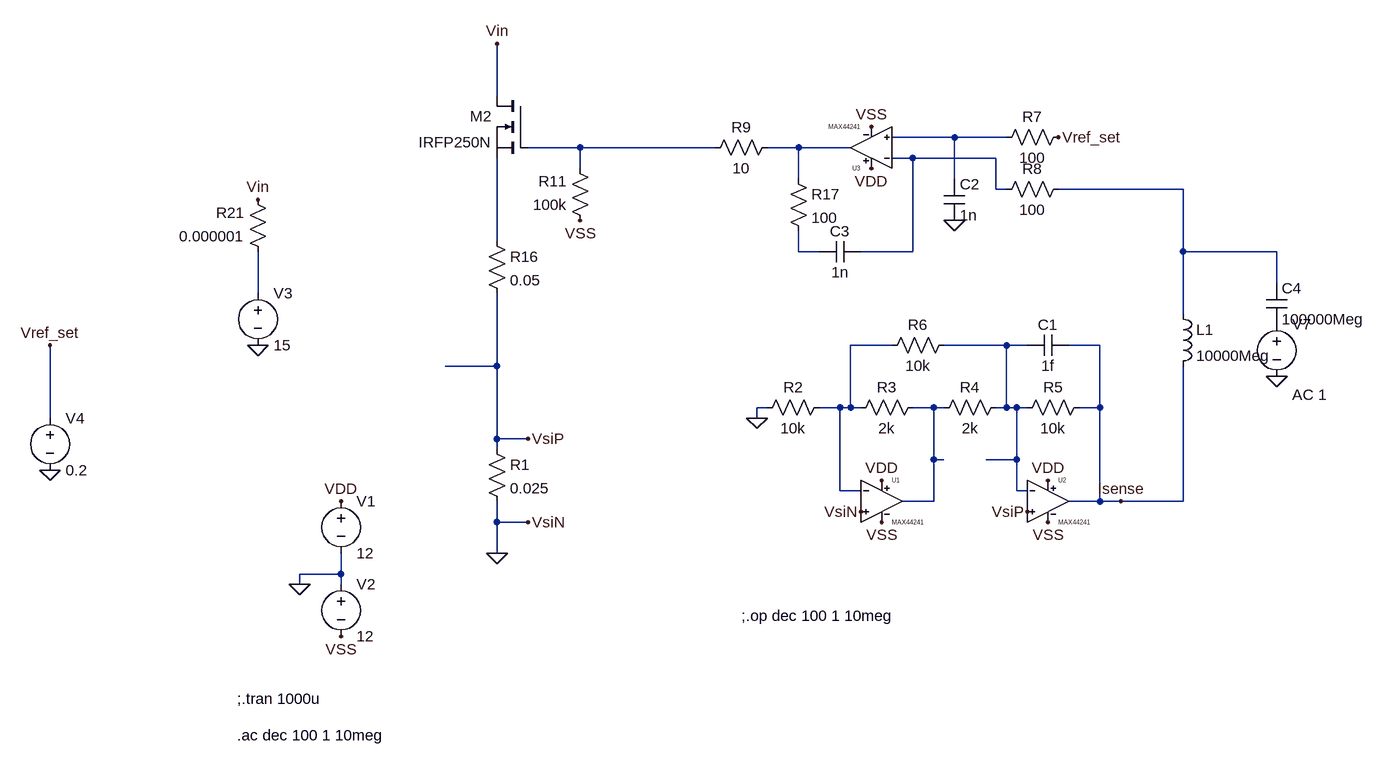
[diagram p0: schematic dc_load_transients_ac_analysis.asc]
dc_load_transients_ac_analysis.asc, the LTspice schematic file:
Version 4
SHEET 1 1884 680
WIRE -352 -336 -352 -416
WIRE 352 -272 256 -272
WIRE 432 -272 352 -272
WIRE -224 -256 -304 -256
WIRE -16 -256 -224 -256
WIRE 112 -256 64 -256
WIRE 192 -256 112 -256
WIRE 288 -240 256 -240
WIRE 416 -240 288 -240
WIRE -224 -224 -224 -256
WIRE 112 -208 112 -256
WIRE 352 -208 352 -272
WIRE 416 -192 416 -240
WIRE 432 -192 416 -192
WIRE 704 -192 512 -192
WIRE -352 -112 -352 -240
WIRE 112 -96 112 -128
WIRE 144 -96 112 -96
WIRE 288 -96 288 -240
WIRE 288 -96 208 -96
WIRE 704 -96 704 -192
WIRE 848 -96 704 -96
WIRE 848 -48 848 -96
WIRE -720 -32 -720 -96
WIRE 704 0 704 -96
WIRE 256 48 192 48
WIRE 432 48 336 48
WIRE 464 48 432 48
WIRE 576 48 528 48
WIRE -352 80 -352 -32
WIRE -352 80 -432 80
WIRE 64 144 48 144
WIRE 176 144 144 144
WIRE 192 144 192 48
WIRE 192 144 176 144
WIRE 208 144 192 144
WIRE 320 144 288 144
WIRE 336 144 320 144
WIRE 432 144 432 48
WIRE 432 144 416 144
WIRE 448 144 432 144
WIRE 464 144 448 144
WIRE 576 144 576 48
WIRE 576 144 544 144
WIRE -1040 160 -1040 48
WIRE 48 160 48 144
WIRE -352 192 -352 80
WIRE -304 192 -352 192
WIRE -352 208 -352 192
WIRE 320 224 320 144
WIRE 336 224 320 224
WIRE 448 224 448 144
WIRE 448 224 400 224
WIRE 176 272 176 144
WIRE 208 272 176 272
WIRE 448 272 448 224
WIRE 464 272 448 272
WIRE 320 288 320 224
WIRE 320 288 272 288
WIRE 576 288 576 144
WIRE 576 288 528 288
WIRE 608 288 576 288
WIRE 704 288 704 80
WIRE 704 288 608 288
WIRE -352 320 -352 288
WIRE -304 320 -352 320
WIRE -352 368 -352 320
WIRE -592 400 -592 368
WIRE -592 400 -656 400
WIRE -656 416 -656 400
WIRE -592 416 -592 400
FLAG -352 368 0
FLAG -592 288 VDD
FLAG -592 496 VSS
FLAG -656 416 0
FLAG 240 256 VDD
FLAG 496 256 VDD
FLAG 240 320 VSS
FLAG 496 320 VSS
FLAG 48 160 0
FLAG -304 192 VsiP
FLAG 464 304 VsiP
FLAG -304 320 VsiN
FLAG 208 304 VsiN
FLAG 608 288 Isense
FLAG -720 48 0
FLAG -720 -176 Vin
FLAG -1040 48 Vref_set
FLAG -1040 240 0
FLAG 352 -144 0
FLAG 512 -272 Vref_set
FLAG -224 -144 VSS
FLAG -352 -416 Vin
FLAG 224 -224 VDD
FLAG 224 -288 VSS
FLAG 848 96 0
DATAFLAG 704 288 ""
DATAFLAG -352 80 ""
DATAFLAG -352 -192 ""
DATAFLAG -1040 80 ""
DATAFLAG 368 -272 ""
DATAFLAG 288 -240 ""
DATAFLAG 704 -96 ""
DATAFLAG -352 -400 ""
DATAFLAG -208 -256 ""
DATAFLAG 176 272 ""
DATAFLAG -352 320 ""
DATAFLAG -352 192 ""
DATAFLAG 464 304 ""
DATAFLAG 176 256 ""
SYMBOL my\\MAX44241 240 224 R0
SYMATTR InstName U1
SYMBOL my\\MAX44241 496 224 R0
SYMATTR InstName U2
SYMBOL res -368 192 R0
SYMATTR InstName R1
SYMATTR Value 0.025
SYMBOL res 160 128 R90
WINDOW 0 0 56 VBottom 2
WINDOW 3 32 56 VTop 2
SYMATTR InstName R2
SYMATTR Value 10k
SYMBOL res 304 128 R90
WINDOW 0 0 56 VBottom 2
WINDOW 3 32 56 VTop 2
SYMATTR InstName R3
SYMATTR Value 2k
SYMBOL res 432 128 R90
WINDOW 0 0 56 VBottom 2
WINDOW 3 32 56 VTop 2
SYMATTR InstName R4
SYMATTR Value 2k
SYMBOL res 560 128 R90
WINDOW 0 0 56 VBottom 2
WINDOW 3 32 56 VTop 2
SYMATTR InstName R5
SYMATTR Value 10k
SYMBOL res 352 32 R90
WINDOW 0 0 56 VBottom 2
WINDOW 3 32 56 VTop 2
SYMATTR InstName R6
SYMATTR Value 10k
SYMBOL voltage -592 272 R0
WINDOW 123 0 0 Left 2
WINDOW 39 0 0 Left 2
SYMATTR InstName V1
SYMATTR Value 12
SYMBOL voltage -592 400 R0
WINDOW 123 0 0 Left 2
WINDOW 39 0 0 Left 2
SYMATTR InstName V2
SYMATTR Value 12
SYMBOL voltage -720 -48 R0
WINDOW 123 24 124 Left 2
WINDOW 39 0 0 Left 2
SYMATTR InstName V3
SYMATTR Value 15
SYMBOL voltage -1040 144 R0
WINDOW 123 0 0 Left 2
WINDOW 39 0 0 Left 2
SYMATTR InstName V4
SYMATTR Value 0.2
SYMBOL my\\MAX44241 224 -192 R180
SYMATTR InstName U3
SYMBOL res 528 -288 R90
WINDOW 0 0 56 VBottom 2
WINDOW 3 32 56 VTop 2
SYMATTR InstName R7
SYMATTR Value 100
SYMBOL res 528 -208 R90
WINDOW 0 0 56 VBottom 2
WINDOW 3 32 56 VTop 2
SYMATTR InstName R8
SYMATTR Value 100
SYMBOL cap 336 -208 R0
SYMATTR InstName C2
SYMATTR Value 1n
SYMBOL res 80 -272 R90
WINDOW 0 0 56 VBottom 2
WINDOW 3 32 56 VTop 2
SYMATTR InstName R9
SYMATTR Value 10
SYMBOL res -208 -128 R180
WINDOW 0 36 76 Left 2
WINDOW 3 36 40 Left 2
SYMATTR InstName R11
SYMATTR Value 100k
SYMBOL nmos -304 -336 M0
SYMATTR InstName M2
SYMATTR Value IRFP250N
SYMBOL cap 528 32 R90
WINDOW 0 0 32 VBottom 2
WINDOW 3 32 32 VTop 2
SYMATTR InstName C1
SYMATTR Value 1f
SYMBOL cap 208 -112 R90
WINDOW 0 0 32 VBottom 2
WINDOW 3 32 32 VTop 2
SYMATTR InstName C3
SYMATTR Value 1n
SYMBOL res -368 -128 R0
SYMATTR InstName R16
SYMATTR Value 0.05
SYMBOL res -704 -80 R180
WINDOW 0 36 76 Left 2
WINDOW 3 36 40 Left 2
SYMATTR InstName R21
SYMATTR Value 0.000001
SYMBOL res 96 -224 R0
SYMATTR InstName R17
SYMATTR Value 100
SYMBOL ind 688 -16 R0
SYMATTR InstName L1
SYMATTR Value 10000Meg
SYMBOL cap 832 -48 R0
SYMATTR InstName C4
SYMATTR Value 100000Meg
SYMBOL voltage 848 0 R0
WINDOW 123 24 124 Left 2
WINDOW 39 0 0 Left 0
SYMATTR Value2 AC 1
SYMATTR InstName V7
SYMATTR Value ""
TEXT -752 592 Left 2 !;.tran 1000u
TEXT -752 648 Left 2 !.ac dec 100 1 10meg
TEXT 24 464 Left 2 !;.op dec 100 1 10meg

The netlist it stands for:
* dc_load_transients_ac_analysis.asc
XU1 0 N009 VDD VSS N011 MAX44241  ; pins INA+ INA- VDD VSS OUTA
XU2 VsiP N010 VDD VSS Isense MAX44241  ; pins INA+ INA- VDD VSS OUTA
R1 VsiP 0 0.025
R2 N009 0 10k
R3 N011 N009 2k
R4 N010 N011 2k
R5 Isense N010 10k
R6 N010 N009 10k
V1 VDD 0 12
V2 0 VSS 12
V3 N008 0 15
V4 Vref_set 0 0.2
XU3 N001 N004 VDD VSS N003 MAX44241  ; pins INA+ INA- VDD VSS OUTA
R7 Vref_set N001 100
R8 N005 N004 100
C2 N001 0 1n
R9 N003 N002 10
R11 VSS N002 100k
M2 Vin N002 N006 N006 IRFP250N
C1 Isense N010 1f
C3 N004 N007 1n
R16 N006 VsiP 0.05
R21 N008 Vin 0.000001
R17 N003 N007 100
L1 N005 Isense 10000Meg
C4 N005 P001 100000Meg
V7 P001 0 AC 1
.model NMOS NMOS
.model PMOS PMOS
.lib standard.mos
;.tran 1000u
.ac dec 100 1 10meg
;.op dec 100 1 10meg
.lib MAX44241.lib
.backanno
.end